# Altium schematic sheet PSOC_SPI_BUS.SchDoc
size A3; SheetNumber: 5; SheetTotal: 7
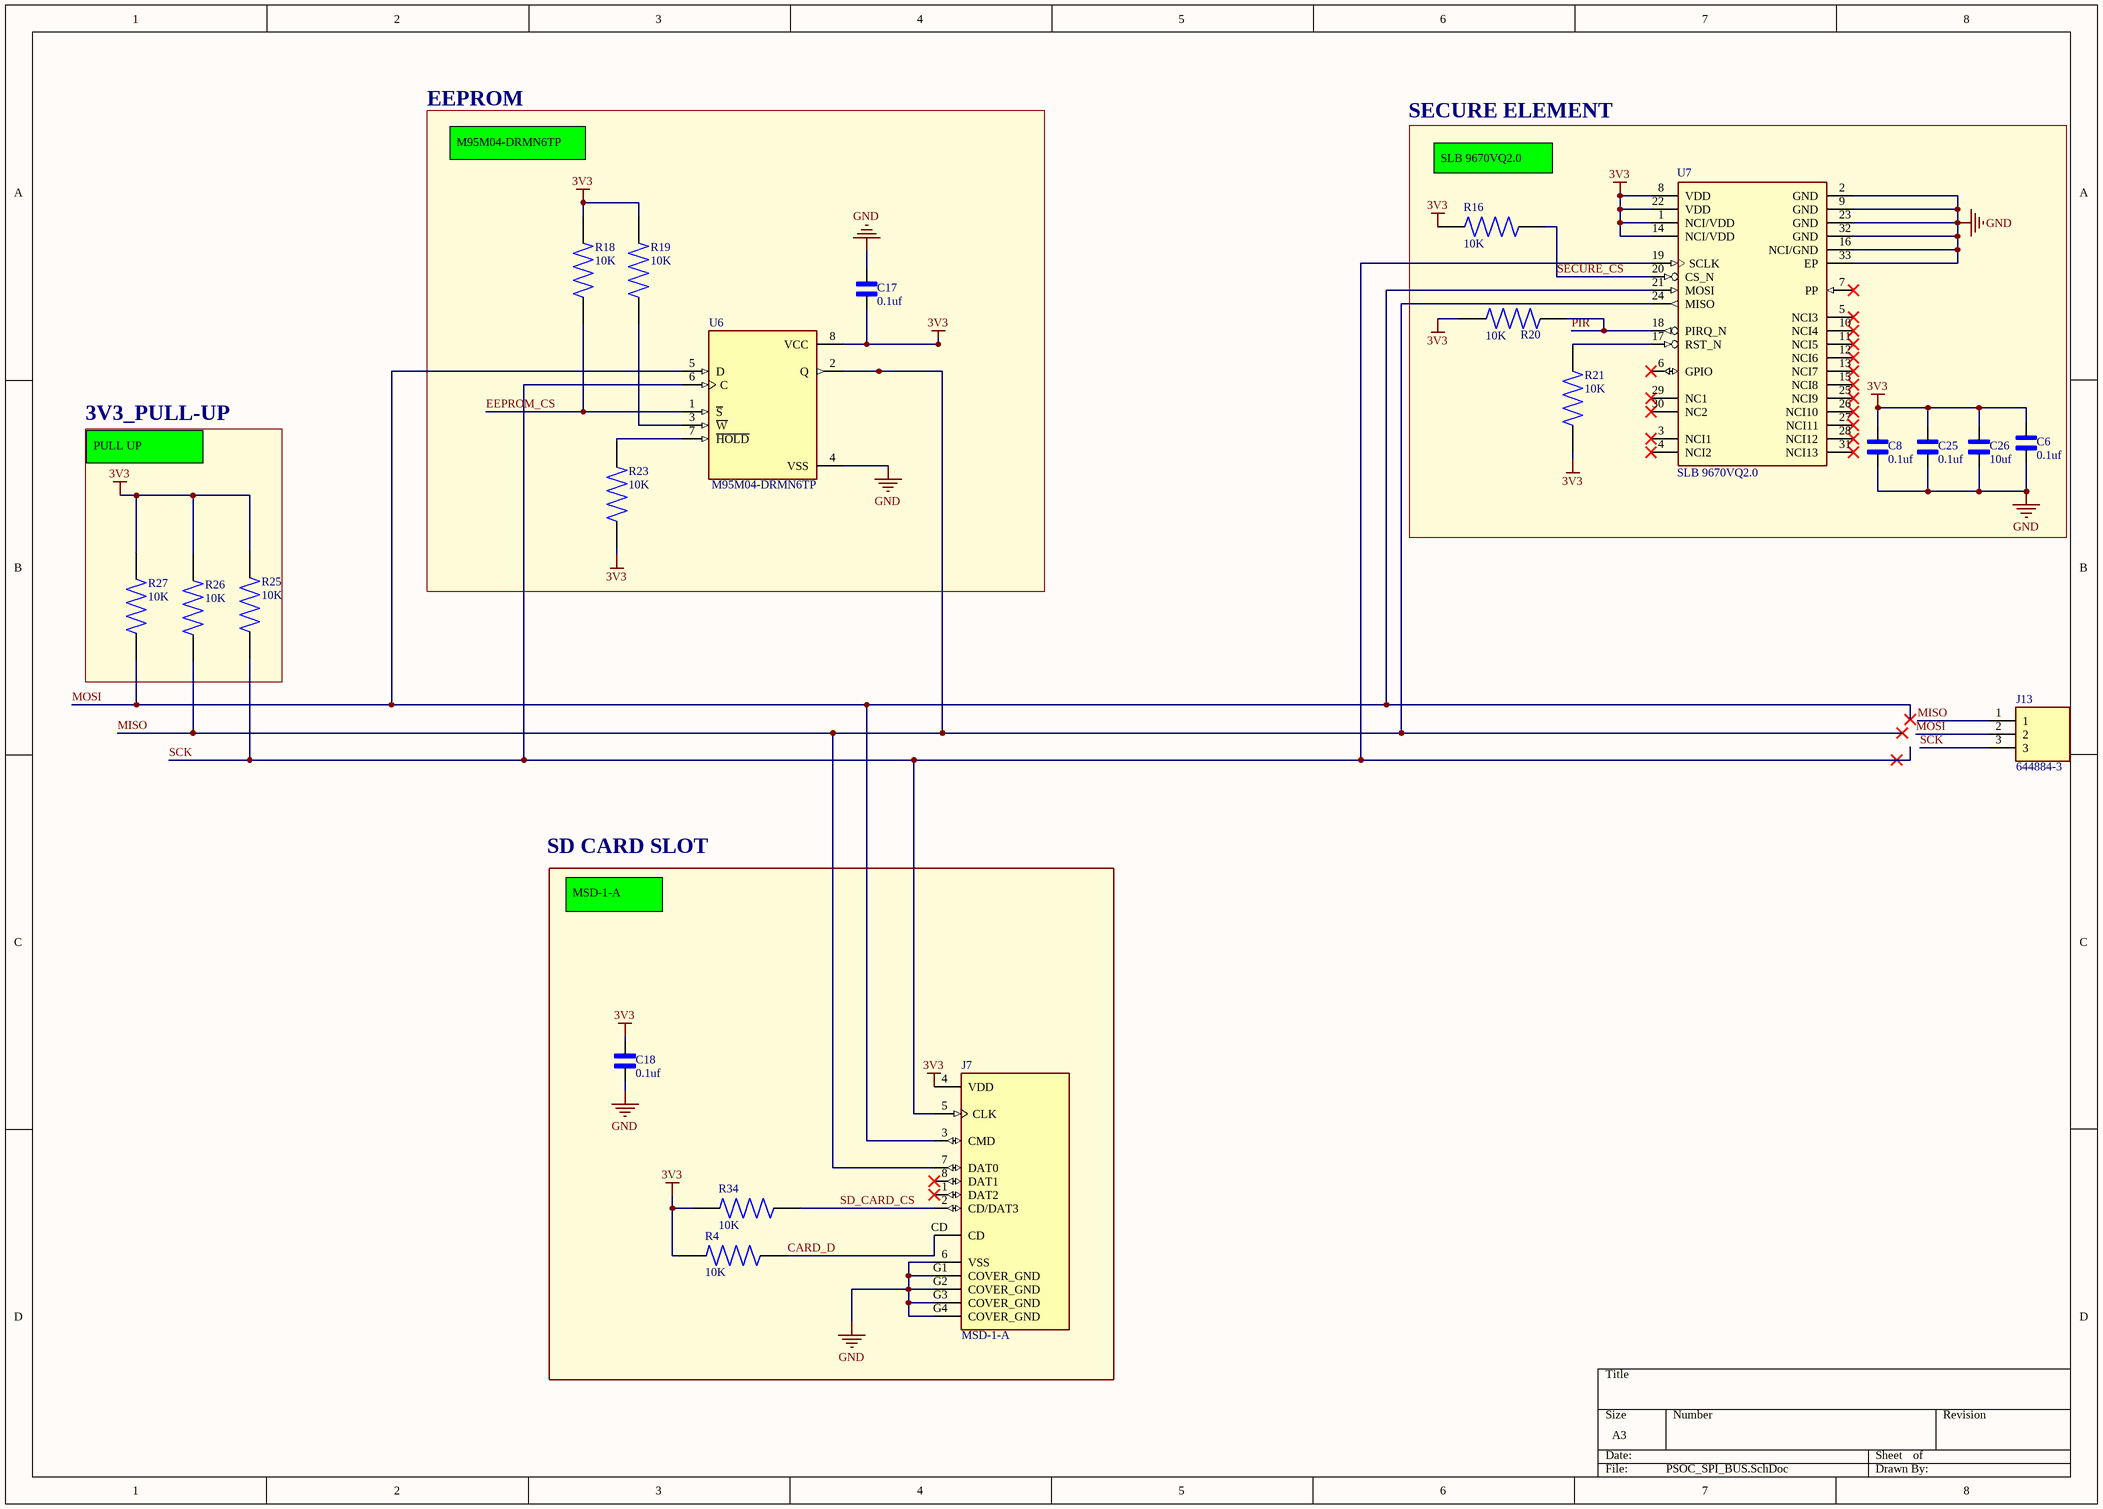
[diagram p0: PSOC_SPI_BUS.SchDoc]

## Parts
C6  0.1uf  [CAPC1005X55N]
C8  0.1uf  [CAPC1005X55N]
C17  0.1uf  [CAPC1005X55N]
C18  0.1uf  [CAPC1005X55N]
C25  0.1uf  [CAPC1005X55N]
C26  10uf  [CAPC3216X229N]
J7  MSD-1-A  [CUI_MSD-1-A]
J13  644884-3  [TE_644884-3]
R4  10K  [RESC1005X40N]
R16  10K  [RESC1005X40N]
R18  10K  [RESC1005X40N]
R19  10K  [RESC1005X40N]
R20  10K  [RESC1005X40N]
R21  10K  [RESC1005X40N]
R23  10K  [RESC1005X40N]
R25  10K  [RESC1005X40N]
R26  10K  [RESC1005X40N]
R27  10K  [RESC1005X40N]
R34  10K  [RESC1005X40N]
U6  M95M04-DRMN6TP  [SOIC127P600X175-8N]
U7  SLB 9670VQ2.0  [QFN50P500X500X90-33N-V]

## Blocks framed on the sheet
EEPROM: C17 R18 R19 R23 U6
SECURE ELEMENT: C6 C8 C25 C26 R16 R20 R21 U7
3V3_PULL-UP: R25-R27
SD CARD SLOT: C18 J7 R4 R34

## Nets
3V3: C6.1 C8.1 C17.2 C18.2 C25.1 C26.2 J7.4(VDD) R4.1 R16.1 R18.2 R19.2 R20.1 R21.1 R23.1 R25.2 R26.2 R27.2 R34.1 U6.8(VCC) U7.1(NCI/VDD) U7.8(VDD) U7.14(NCI/VDD) U7.22(VDD)
GND: C6.2 C8.2 C17.1 C18.1 C25.2 C26.1 J7.6(VSS) J7.G1(COVER_GND) J7.G2(COVER_GND) J7.G3(COVER_GND) J7.G4(COVER_GND) U6.4(VSS) U7.2(GND) U7.9(GND) U7.16(NCI/GND) U7.23(GND) U7.32(GND) U7.33(EP)
CARD_D: J7.CD R4.2
EEPROM_CS: R18.1 U6.1(~{S})
MISO: J7.7(DAT0) J13.1 R26.1 U6.2(Q) U7.24(MISO)
MOSI: J7.3(CMD) J13.2 R27.1 U6.5(D) U7.21(MOSI)
PIR: R20.2 U7.18(PIRQ_N)
SCK: J7.5(CLK) J13.3 R25.1 U6.6(C) U7.19(SCLK)
SD_CARD_CS: J7.2(CD/DAT3) R34.2
SECURE_CS: R16.2 U7.20(CS_N)
NetR19_1: R19.1 U6.3(~{W})
NetR21_2: R21.2 U7.17(RST_N)
NetR23_2: R23.2 U6.7(~{HOLD})

Not connected (* = marked no-connect by the designer): J7 1(DAT2)* 8(DAT1)*; U7 3(NCI1)* 4(NCI2)* 5(NCI3)* 6(GPIO)* 7(PP)* 10(NCI4)* 11(NCI5)* 12(NCI6)* 13(NCI7)* 15(NCI8)* 25(NCI9)* 26(NCI10)* 27(NCI11)* 28(NCI12)* 29(NC1)* 30(NC2)* 31(NCI13)*

## Notes on the sheet
- M95M04-DRMN6TP
- SLB 9670VQ2.0
- PULL UP
- MSD-1-A

## Library data of the parts
C6 C8 C17 C18 C25 = C0402T104K4RACTU: Cap Ceramic 0.1uF 16V X7R 10% SMD 0402 85Â°C Punched Paper T/R; MF: KEMET; SnapEDA_Link: https://www.snapeda.com/parts/C0402T104K4RACTU/KEMET/view-part/?ref=snap; Package: 0402 KEMET; Value: *; MP: C0402T104K4RACTU; Check_prices: https://www.snapeda.com/parts/C0402T104K4RACTU/KEMET/view-part/?ref=eda
C26 = 1206ZD226MAT2A: 0,1 ÂµF Â±%10 16V Seramik KondansatÃ¶r X7R 0402 (1005 Metrik); MF: AVX; SnapEDA_Link: https://www.snapeda.com/parts/1206ZD226MAT2A/AVX/view-part/?ref=snap; Package: 3216 AVX; Value: *; MP: 1206ZD226MAT2A; Check_prices: https://www.snapeda.com/parts/1206ZD226MAT2A/AVX/view-part/?ref=eda
J7 = MSD-1-A: Micro SD Card Connector, 9 Positions, Connector and Ejector, Push In, Auto Eject Out, Surface Mount, 1.8 mm Height Above Board, Gold Flash; MF: Same Sky; SnapEDA_Link: https://www.snapeda.com/parts/MSD-1-A/Same+Sky/view-part/?ref=snap; Package: None; Value: *; MP: MSD-1-A; Check_prices: https://www.snapeda.com/parts/MSD-1-A/Same+Sky/view-part/?ref=eda
J13 = 644884-3: Conn Unshrouded Header HDR 3 POS 2.54mm Solder ST Thru-Hole Bag/Box; MF: TE Connectivity; SnapEDA_Link: https://www.snapeda.com/parts/644884-3/TE+Connectivity+AMP+Connectors/view-part/?ref=snap; Package: None; Value: *; MP: 644884-3; EU_RoHS_Compliance: Compliant; Check_prices: https://www.snapeda.com/parts/644884-3/TE+Connectivity+AMP+Connectors/view-part/?ref=eda
R4 R16 R18-R21 R23 R25-R27 R34 = RL0402FR-070R1L: 100 mOhms Â±1% 0.063W, 1/16W Chip Resistor 0402 (1005 Metric) Automotive AEC-Q200, Current Sense, Moisture Resistant Thick Film; MF: Yageo; SnapEDA_Link: https://www.snapeda.com/parts/RL0402FR-070R1L/Yageo/view-part/?ref=snap; Package: 0402-2 Yageo; Value: *; MP: RL0402FR-070R1L; Check_prices: https://www.snapeda.com/parts/RL0402FR-070R1L/Yageo/view-part/?ref=eda
U6 = M95M04-DRMN6TP: EEPROM Memory IC 4Mb (512K x 8) SPI 10 MHz 8-SOIC; MF: STMicroelectronics; SnapEDA_Link: https://www.snapeda.com/parts/M95M04-DRMN6TP/STMicroelectronics/view-part/?ref=snap; Package: None; Value: *; MP: M95M04-DRMN6TP; Check_prices: https://www.snapeda.com/parts/M95M04-DRMN6TP/STMicroelectronics/view-part/?ref=eda
U7 = SLB 9670VQ2.0: OPTIGA™ TPM; Manufacturer: Infineon Technologies; ManufacturerPartNumber: SLB 9670VQ2.0; PackageReference: PG-VQFN-32-13